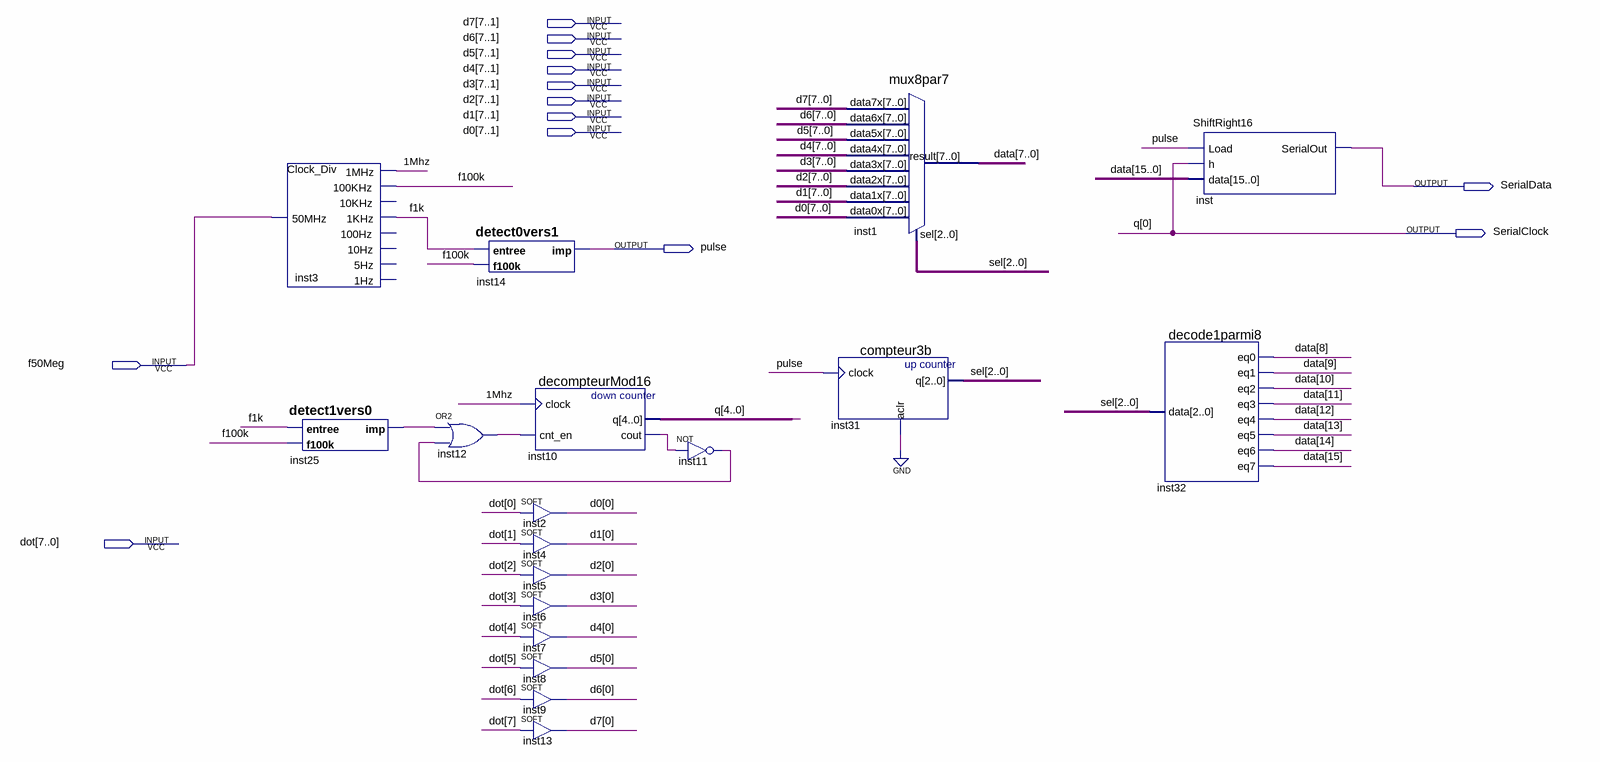
[diagram p0: schematic sheet]
// Quartus schematic DriverAffich8D.bdf as structural Verilog: 18 symbols, 13 pins
module DriverAffich8D (
  input  [7:0] d7,
  input  [7:0] d6,
  input  [7:0] d5,
  input  [7:0] d4,
  input  [7:0] d3,
  input  [7:0] d2,
  input  [7:0] d1,
  input  [7:0] d0,
  input  f50Meg,
  input  [7:0] dot,
  output SerialData,
  output SerialClock,
  output pulse
);

  wire \1Mhz , f1k, f100k, inst10_cout, inst11_out, inst12_out, inst25_imp;
  wire [2:0] sel;
  wire [4:1] q;
  wire [15:0] data;

  Clock_Div inst3 (
    .\50MHz (f50Meg), .\1MHz (\1Mhz ), .\100KHz (f100k), .\1KHz (f1k));  // open: 10KHz, 100Hz, 10Hz, 5Hz, 1Hz
  detect1vers0 inst25 (.entree(f1k), .f100k(f100k), .imp(inst25_imp));
  detect0vers1 inst14 (.entree(f1k), .f100k(f100k), .imp(pulse));
  or inst12 (inst12_out, inst25_imp, inst11_out);
  decompteurMod16 inst10 (.clock(\1Mhz ), .cnt_en(inst12_out), .q({q, SerialClock}), .cout(inst10_cout));
  SOFT inst2 (.IN(dot[0]), .OUT(d0[0]));
  SOFT inst4 (.IN(dot[1]), .OUT(d1[0]));
  SOFT inst5 (.IN(dot[2]), .OUT(d2[0]));
  SOFT inst6 (.IN(dot[3]), .OUT(d3[0]));
  SOFT inst7 (.IN(dot[4]), .OUT(d4[0]));
  SOFT inst8 (.IN(dot[5]), .OUT(d5[0]));
  SOFT inst9 (.IN(dot[6]), .OUT(d6[0]));
  SOFT inst13 (.IN(dot[7]), .OUT(d7[0]));
  not inst11 (inst11_out, inst10_cout);
  mux8par7 inst1 (
    .data7x(d7), .data6x(d6), .data5x(d5), .data4x(d4), .data3x(d3), .data2x(d2), .data1x(d1), .data0x(d0),
    .sel(sel), .result(data[7:0]));
  compteur3b inst31 (.clock(pulse), .aclr(1'b0), .q(sel));
  decode1parmi8 inst32 (
    .data(sel), .eq0(data[8]), .eq1(data[9]), .eq2(data[10]), .eq3(data[11]), .eq4(data[12]), .eq5(data[13]),
    .eq6(data[14]), .eq7(data[15]));
  ShiftRight16 inst (.Load(pulse), .h(SerialClock), .data(data), .SerialOut(SerialData));

  // Other names for the same wires on the sheet: q[0] = SerialClock
endmodule
